# EAGLE design rp2040zero_display_encoder (EAGLE 6.2)
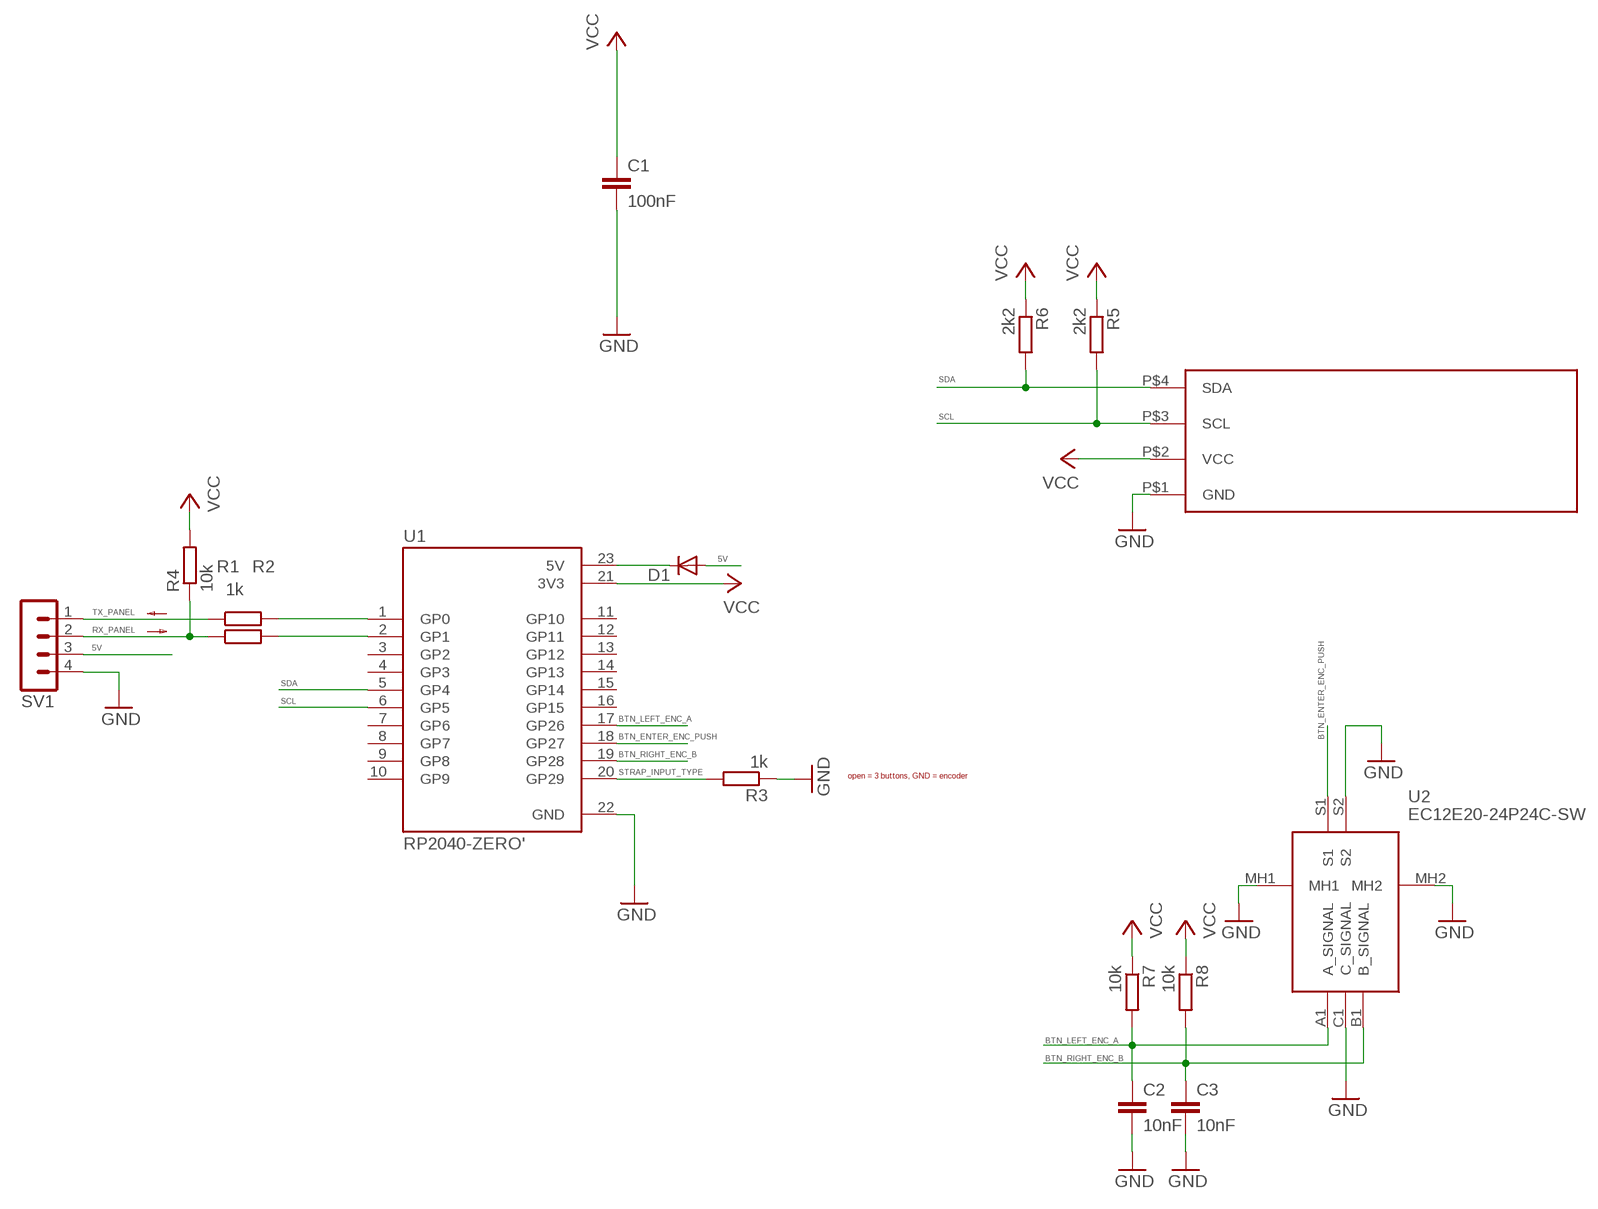
[diagram p0: schematic, sheet 1]

## Parts
C1  100nF  C-EUC0603  [C0603]
C2  10nF  C-EUC0603  [C0603]
C3  10nF  C-EUC0603  [C0603]
D1  SK110-DIO  DIODE-DO214AC  [DO214AC]
R1  1k  R-EU_R0603  [R0603]
R2  1k  R-EU_R0603  [R0603]
R3  1k  R-EU_R0603  [R0603]
R4  10k  R-EU_R0603  [R0603]
R5  2k2  R-EU_R0603  [R0603]
R6  2k2  R-EU_R0603  [R0603]
R7  10k  R-EU_R0603  [R0603]
R8  10k  R-EU_R0603  [R0603]
SV1  MA04-1  [MA04-1]
U1  RP2040-ZERO'  [MODULE_RP2040-ZERO]
U2  EC12E20-24P24C-SW  [EC12E2024P24CSW]
U$1  OLED  [SIP]

## Nets
5V: D1.A SV1.3
BTN_ENTER_ENC_PUSH: U1.18(GP27) U2.S1
BTN_LEFT_ENC_A: C2.1 R7.2 U1.17(GP26) U2.A1(A_SIGNAL)
BTN_RIGHT_ENC_B: C3.1 R8.2 U1.19(GP28) U2.B1(B_SIGNAL)
GND: C1.2 C2.2 C3.2 R3.1 SV1.4 U1.22(GND) U2.C1(C_SIGNAL) U2.MH1 U2.MH2 U2.S2 U$1.P$1(GND)
N$1: R1.2 U1.1(GP0)
N$2: R2.2 U1.2(GP1)
N$3: D1.C U1.23(5V)
RX_PANEL: R2.1 R4.1 SV1.2
SCL: R5.2 U1.6(GP5) U$1.P$3(SCL)
SDA: R6.2 U1.5(GP4) U$1.P$4(SDA)
STRAP_INPUT_TYPE: R3.2 U1.20(GP29)
TX_PANEL: R1.1 SV1.1
VCC: C1.1 R4.2 R5.1 R6.1 R7.1 R8.1 U1.21(3V3) U$1.P$2(VCC)
Unconnected: U1.3(GP2) U1.4(GP3) U1.7(GP6) U1.8(GP7) U1.9(GP8) U1.10(GP9) U1.11(GP10) U1.12(GP11) U1.13(GP12) U1.14(GP13) U1.15(GP14) U1.16(GP15)

## Notes on the sheet
- open = 3 buttons, GND = encoder

## Library data of the parts
C1-C3 = rcl:C-EU: CAPACITOR, European symbol
D1 = diode:DIODE-: DIODE
R1-R8 = resistor:R-EU_: RESISTOR, European symbol
SV1 = con-lstb:MA04-1: PIN HEADER; OC_FARNELL: unknown; OC_NEWARK: unknown
U1 = RP2040-ZERO:RP2040-ZERO: Check availability <https://pricing.snapeda.com/parts/RP2040-ZERO/Waveshare%20Electronics/view-part?ref=eda>; AVAILABILITY: Not in stock; CHECK_PRICES: https://www.snapeda.com/parts/RP2040-ZERO/Waveshare+Electronics/view-part/?ref=eda; DESCRIPTION: Low-Cost, High-Performance Pico-Like MCU Board Based On Raspberry Pi Microcontroller RP2040; MF: Waveshare Electronics; MP: RP2040-ZERO; PACKAGE: Package; PRICE: None; SNAPEDA_LINK: https://www.snapeda.com/parts/RP2040-ZERO/Waveshare+Electronics/view-part/?ref=snap
U2 = EC12E20-24P24C-SW:EC12E20-24P24C-SW: Encoder: incremental; THT; 24imp/revol; Pos: 24; two phase A and B Source: Datasheet <https://www.tme.eu/Document/3355ee49dae2859b0bf824db7ca698f7/EC12E20-24P24C-SW.pdf>; DESCRIPTION: Encoder: incremental; THT; 24imp/revol; Pos: 24; two phase A and B; HEIGHT: 20mm; MANUFACTURER_NAME: SRPASSIVES; MANUFACTURER_PART_NUMBER: EC12E20-24P24C-SW
U$1 = OLED:OLED: I2C 0.91"128x32 OLED

## Board
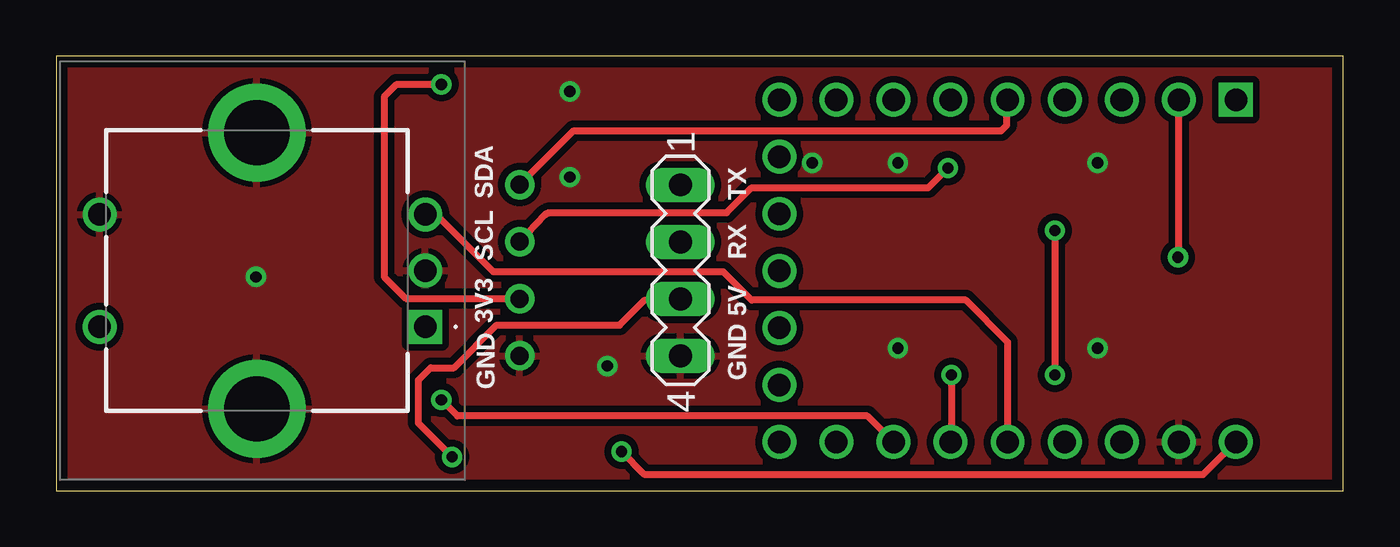
[diagram p1: board, top side]
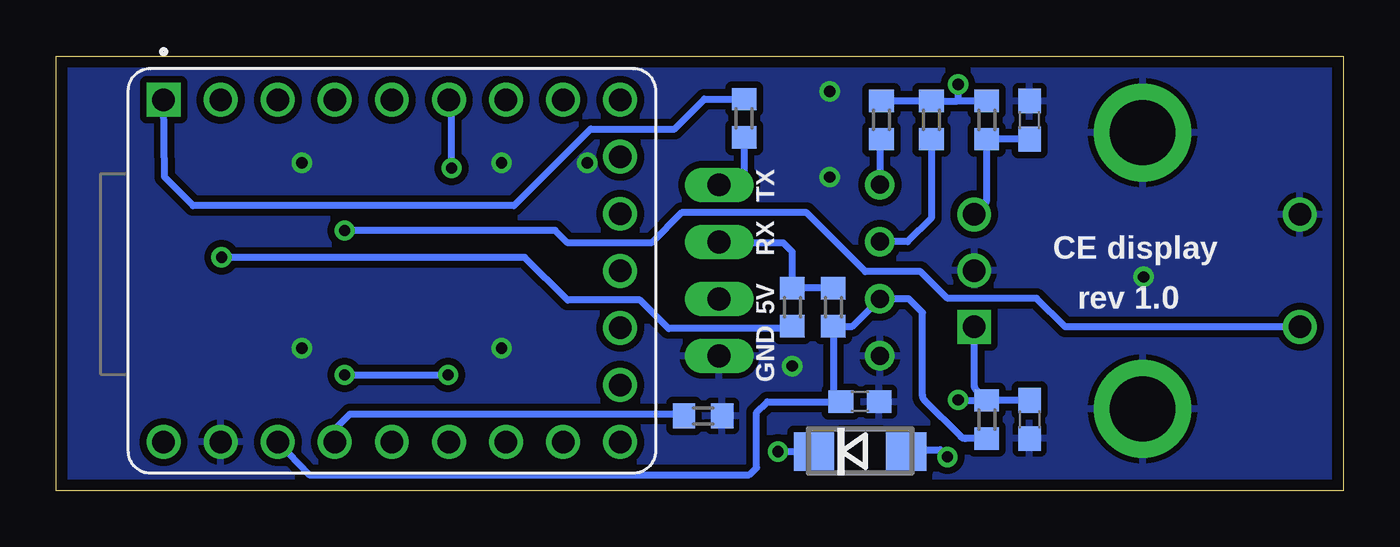
[diagram p2: board, bottom side, seen from below]

Size 57.29 x 19.36 mm. Coordinates in mm from the lower left corner, seen from the top.
Outline: 0,0 57.29,0 57.29,19.36 0,19.36 0,0
Copper layers (1*16): Top 0.035mm / dielectric 1.5mm / Bottom 0.035mm
Design rules: minimum track width 0.2mm, minimum drill 0.5mm, track to track 0.2mm, track to pad 0.2mm, pad to pad 0.2mm, via to via 0.2mm, smd to smd 0.2mm, copper to edge 0.5mm, drill to drill 8mil, minimum pad ring 10mil, minimum via ring 8mil, stop-mask expansion 4mil, vias tented up to drill 0mil, thermal gap 10mil
bRestrict: area 20.6,0.9 to 22.4,2.6

### Footprints (pad centres in the part's own frame; a part is rotated, then mirrored left to right if it is on the bottom)
C0603 = smd 1.1 x 1: 1 -0.85,0; 2 0.85,0
DO214AC = smd 1.8 x 1.7: A 2.05,0; C -2.05,0
R0603 = smd 1 x 1.1: 1 -0.85,0; 2 0.85,0
MA04-1 = drill 1.016 long: 1 -3.81,0; 2 -1.27,0; 3 1.27,0; 4 3.81,0
MODULE_RP2040-ZERO = drill 1 square: 1 7.62,10.16 | drill 1: 2 7.62,7.62; 3 7.62,5.08; 4 7.62,2.54; 5 7.62,0; 6 7.62,-2.54; 7 7.62,-5.08; 8 7.62,-7.62; 9 7.62,-10.16; 10 5.08,-10.16; 11 2.54,-10.16; 12 0,-10.16; 13 -2.54,-10.16; 14 -5.08,-10.16; 15 -7.62,-10.16; 16 -7.62,-7.62; 17 -7.62,-5.08; 18 -7.62,-2.54; 19 -7.62,0; 20 -7.62,2.54; 21 -7.62,5.08; 22 -7.62,7.62; 23 -7.62,10.16
EC12E2024P24CSW = drill 1 pad 1.5 square: A1 0,0 | drill 1 pad 1.5: B1 5,0; C1 2.5,0; S1 0,14.5; S2 5,14.5 | drill 2.9 pad 4.35: MH1 -3.65,7.5; MH2 8.65,7.5
SIP = drill 0.8: P$1 -17.55,-4.16; P$2 -17.55,-1.62; P$3 -17.55,0.92; P$4 -17.55,3.46

### Placement (x,y rotation side)
C1  21.51,3.97 0 bottom
C2  13.97,3.17 270 bottom
C3  13.97,16.51 90 bottom
D1  21.51,1.75 0 bottom
R1  26.67,16.59 90 bottom
R2  24.53,8.18 270 bottom
R3  28.5,3.33 180 bottom
R4  22.7,8.18 270 bottom
R5  18.34,16.51 270 bottom
R6  20.56,16.51 270 bottom
R7  15.88,3.17 90 bottom
R8  15.88,16.51 270 bottom
SV1  27.78,9.81 270 top
U1  42.35,9.79 90 bottom
U2  16.43,7.3 90 top
U$1  38.18,10.17 0 top

### Tracks (layer width: path | path; a pad name or v marks a point on that pad's centre or on a via)
5V  (via drill 0.5)
  Top 0.305: SV1.3 26.19,8.49 25.08,7.38 19.61,7.38 17.7,5.48 16.67,5.48 16.11,4.92 16.11,3.02 v17.62,1.51
  Bottom 0.305: D1.A 19.38,1.83 17.94,1.83 v17.62,1.51
BTN_ENTER_ENC_PUSH  (via drill 0.5)
  Top 0.305: v44.45,11.59 v44.45,5.16 | v39.85,5.16 39.85,2.21 U1.18
  Bottom 0.305: U2.S1 12.38,7.3 13.65,8.57 17.62,8.57 18.81,9.76 21.27,9.76 23.89,12.38 29.45,12.38 30.8,11.03 34.53,11.03 35.08,11.59 v44.45,11.59 | v44.45,5.16 v39.85,5.16
BTN_LEFT_ENC_A  (via drill 0.5)
  Top 0.305: U1.17 36.11,3.33 17.86,3.33 v17.14,4.05
  Bottom 0.305: C2.1 R7.2 | R7.2 16.34,4.49 arc45 16.43,4.71 U2.A1 | v17.14,4.05 16.96,4.03 R7.2
BTN_RIGHT_ENC_B
  Top 0.305: U2.B1 16.91,12.3 19.45,9.76 29.69,9.76 30.96,8.49 40.48,8.49 42.35,6.63 U1.19
  Bottom 0.305: C3.1 R8.2 15.88,12.99 arc45 15.97,12.77 U2.B1
GND  (via drill 0.5)
  other vias: 46.36,6.35 46.36,14.61 37.47,6.35 24.53,5.56 8.89,9.53 22.86,17.78 37.47,14.61 33.66,14.61 22.86,13.97
  pour Top (isolate 0.305): 0,19.37 57.15,19.37 57.15,0.08 0,0.08
  pour Bottom (isolate 0.305): 57.23,19.29 57.23,0.08 0,0.08 0,19.29
N$1
  Bottom 0.305: U1.1 52.47,13.97 51.2,12.7 36.91,12.7 33.5,16.11 29.77,16.11 28.44,17.44 R1.2
N$2  (via drill 0.5)
  Top 0.305: v49.93,10.4 49.97,10.44 U1.2
  Bottom 0.305: R2.2 R2.2 arc45 24.76,7.22 30.03,7.22 31.3,8.49 34.53,8.49 36.43,10.4 v49.93,10.4
N$3  (via drill 0.5)
  Top 0.305: U1.23 51.04,0.71 26.19,0.71 v25.16,1.75
  Bottom 0.305: v25.16,1.75 D1.C
RX_PANEL
  Bottom 0.305: R4.1 R2.1 24.53,10.64 24.92,11.03 27.73,11.03 SV1.2
SCL  (via drill 0.5)
  Top 0.305: U$1.P$3 21.76,12.29 arc-45 21.98,12.38 29.84,12.38 30.96,13.49 38.81,13.49 v39.69,14.37
  Bottom 0.305: v39.69,14.37 39.69,17.11 arc-45 U1.6 | R5.2 18.34,12.14 19.39,11.09 U$1.P$3
SDA
  Top 0.305: U1.5 42.31,16.27 42.07,16.03 23.03,16.03 U$1.P$4
  Bottom 0.305: R6.2 arc-90 20.63,15.59 U$1.P$4
STRAP_INPUT_TYPE
  Bottom 0.305: U1.20 44.85,2.78 44.21,3.41 29.43,3.41 R3.2
TX_PANEL
  Bottom 0.305: R1.1 26.67,13.62 SV1.1
VCC  (via drill 0.5)
  Top 0.305: U$1.P$2 20.58,8.57 15.56,8.57 14.61,9.53 14.61,17.54 15.16,18.1 v17.14,18.1
  Bottom 0.305: R8.1 17.14,17.36 17.14,17.38 | R6.1 R5.1 17.17,17.36 17.14,17.38 | R7.1 16.8,2.32 arc45 17.02,2.42 18.64,4.04 arc45 18.73,4.26 18.73,7.94 19.34,8.55 U$1.P$2 21.85,7.33 R4.2 22.7,4.31 C1.1 25.64,3.97 26.11,3.49 26.11,1.03 26.43,0.71 46.04,0.71 U1.21 | v17.14,18.1 17.14,17.38

### Text on the board
tNames: SDA | TX | SCL | RX | 3V3 | 5V | GND | GND
bNames: TX | CE display | RX | rev 1.0 | 5V | GND